# EasyEDA Pro project travellium-12v-desktop-power-supply-cc8d8467.epro, board PCB7
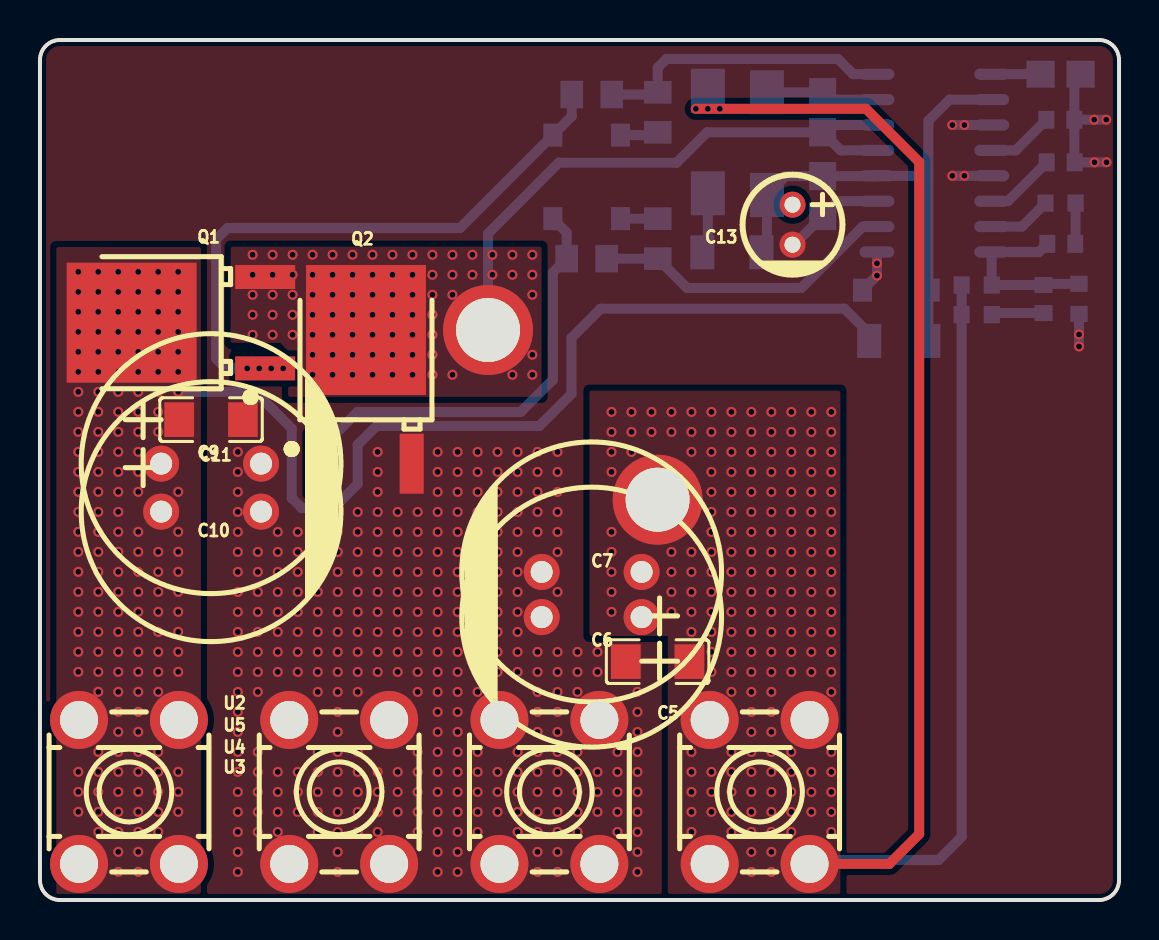
[diagram p11: board, top side]
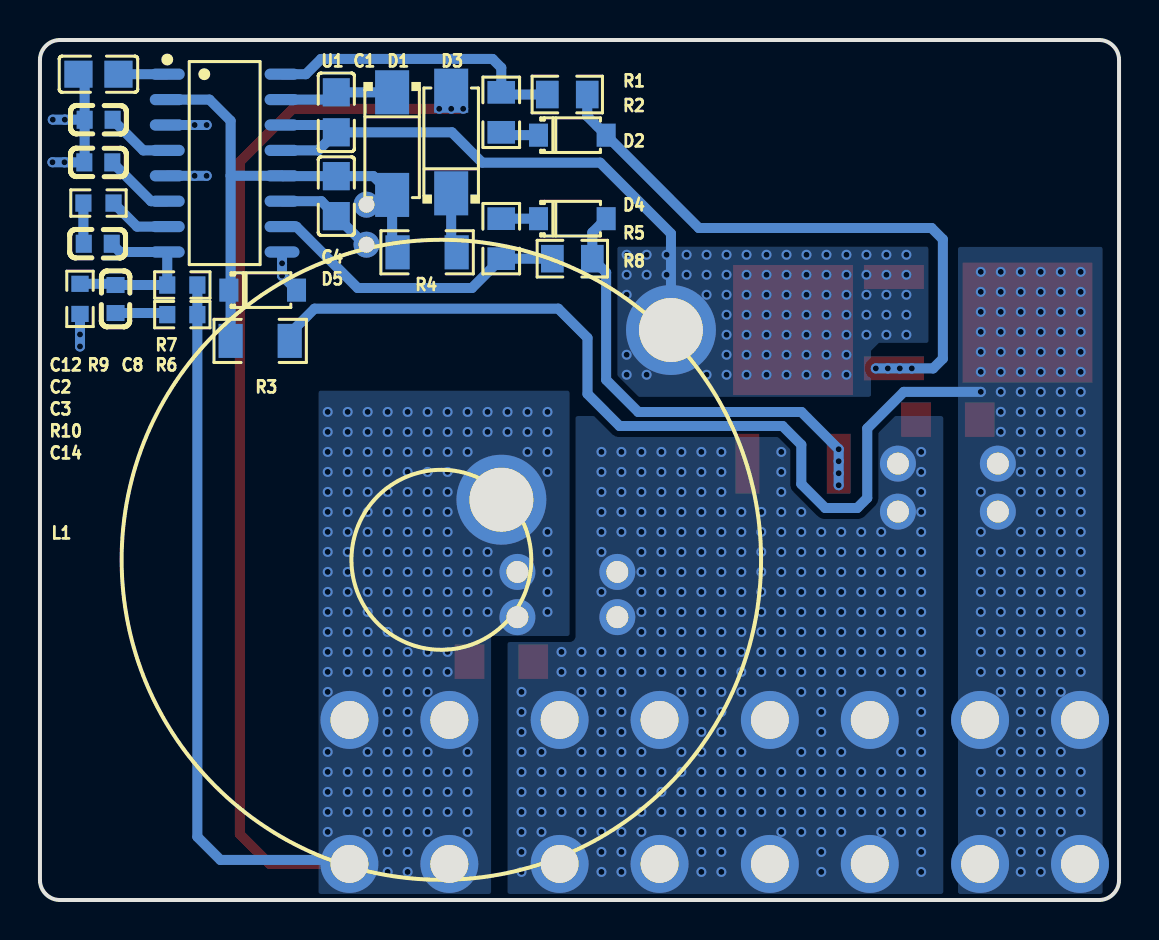
[diagram p12: board, bottom side, seen from below]

Outline 54 x 43 mm; copper layers: Top Layer, Bottom Layer. Coordinates in mm from the lower left corner of the outline.
Outline path: 0,42 0,1 arc(0.29,0.29) 1,0 53,0 arc(53.71,0.29) 54,1 54,42 arc(53.71,42.71) 53,43 1,43 arc(0.29,42.71) 0,42
Stack: Top Layer 0.035mm / Dielectric1 1.51mm FR4 er 4.5 / Bottom Layer 0.035mm

## Design rules (mm)
spacing copperThickness1oz (default): track to track 0.102, other pairs 0.152 to 0.3
spacing copperThickness2oz: track to track 0.203, other pairs 0.152 to 0.3
spacing Plane_innerPlane: track to track 0.102, other pairs 0.152 to 0.3
spacing Copper_copperRegion: track to track 0.102, other pairs 0.152 to 0.3
track width copperThickness1oz: min 0.127, default 0.254, max 2.54
track width copperThickness2oz: min 0.203, default 0.254, max 2.54
track width Travellium (default): min 0.1, default 0.2, max 10
differential pair differentialPair (default): width min 0.127, default 0.254, max 2.54; gap min 0.152, default 0.152
pour e868 uses Copper_copperRegion
pour e870 uses Copper_copperRegion
pour e872 uses Copper_copperRegion
pour e874 uses Copper_copperRegion
pour e876 uses Copper_copperRegion
pour e878 uses Copper_copperRegion
pour e880 uses Copper_copperRegion
pour e882 uses Copper_copperRegion

## Placement (name value [footprint] x y rotation side)
C1  1uF  [C0805]  39.17 39.38 90 bottom
C2  100pF  [C0603]  51.07 39.01 180 bottom
C3  200pF  [C0603]  51.08 36.88 0 bottom
C4  1uF  [C0805]  39.17 35.19 90 bottom
C5  100nF  [C1206]  30.91 11.92 0 top
C6  470uF  [CAP-TH_BD13.0-P5.00-D0.6-FD]  27.61 14.14 180 top
C7  470uF  [CAP-TH_BD13.0-P5.00-D0.6-FD]  27.61 16.4 180 top
C8  10nF  [C0603]  50.22 30.05 270 bottom
C9  470uF  [CAP-TH_BD13.0-P5.00-D0.6-FD]  8.56 21.82 0 top
C10  470uF  [CAP-TH_BD13.0-P5.00-D0.6-FD]  8.56 19.42 0 top
C11  100nF  [C1206]  8.56 24.02 180 top
C12  1uF  [C0805]  51.07 41.29 0 bottom
C13  10uF  [CAP-TH_BD5.0-P2.00-D0.8-FD]  37.66 33.77 270 top
C14  10nF  [C0603]  51.11 32.81 180 bottom
D1  SS14  [SMA_L4.2-W2.6-LS5.3-RD]  36.38 37.82 270 bottom
D2  1N4148W  [SOD-123_L2.8-W1.8-LS3.7-RD]  27.36 38.24 180 bottom
D3  SS14  [SMA_L4.2-W2.6-LS5.3-RD]  33.42 37.9 90 bottom
D4  1N4148W  [SOD-123_L2.8-W1.8-LS3.7-RD]  27.36 34.07 180 bottom
D5  BZT52C18  [SOD-123_L2.8-W1.8-LS3.7-RD]  42.85 30.49 180 bottom
L1  106125-22uH  [106125]  33.91 17.01 135 bottom
Q1  APG095N01K  [TO-252-3_L6.6-W6.1-P4.58-LS10.1-BR-1]  7.93 28.86 0 top
Q2  APG095N01K  [TO-252-3_L6.6-W6.1-P4.58-LS10.1-BR-1]  16.32 25.16 270 top
R1  15Ω  [R0805]  27.61 40.27 180 bottom
R2  2.2Ω  [R0805]  30.92 39.38 270 bottom
R3  75kΩ  [R1206]  42.98 27.95 0 bottom
R4  51Ω  [R1206]  34.63 32.38 180 bottom
R5  2.2Ω  [R0805]  30.92 33.07 90 bottom
R6  1.5kΩ  [R0603]  46.88 29.27 180 bottom
R7  9.1kΩ  [R0603]  46.88 30.75 180 bottom
R8  15Ω  [R0805]  27.36 32.07 180 bottom
R9  1kΩ  [R0603]  52 30.06 90 bottom
R10  20kΩ  [R0603]  51.07 34.85 0 bottom
U1  EG1163S  [SOP-16_L10.0-W3.9-P1.27-LS6.0-BL]  44.76 36.84 270 bottom
U2  T44001  [CONN-TH_T44001]  4.45 5.4 0 top
U3  T44001  [CONN-TH_T44001]  36.01 5.4 0 top
U4  T44001  [CONN-TH_T44001]  25.49 5.4 0 top
U5  T44001  [CONN-TH_T44001]  14.97 5.4 0 top

## Footprints (pads in the part's own frame, mm; a bottom-side part is the same pattern mirrored in y, then rotated)
106125
  round 4.5 hole 3.2: 1(4.25,0) 2(16.25,0)
C0603
  rect 0.8x0.9 smd: 1(-0.7,0) 2(0.7,0)
C0805
  rect 1.41x1.35 smd: 1(-1,0) 2(1,0)
C1206
  rect 1.485x1.728 smd: 1(-1.593,0) 2(1.593,0)
CAP-TH_BD5.0-P2.00-D0.8-FD
  round 1.3 hole 0.8: 1(-1,0) 2(1,0)
CAP-TH_BD13.0-P5.00-D0.6-FD
  round 1.8 hole 1.1: 1(-2.5,0) 2(2.5,0)
CONN-TH_T44001
  round 2.9 hole 1.9: 1(-2.5,3.6) 2(-2.5,-3.6) 3(2.5,-3.6) 4(2.5,3.6)
R0603
  rect 0.806x0.864 smd: 1(-0.753,0) 2(0.753,0)
R0805
  rect 1.133x1.377 smd: 1(-1,0) 2(1,0)
R1206
  rect 1.208x1.701 smd: 1(-1.479,0) 2(1.479,0)
SMA_L4.2-W2.6-LS5.3-RD
  rect 2.2x1.7 smd: 1(-2.566,0) 2(2.566,0)
SOD-123_L2.8-W1.8-LS3.7-RD
  rect 0.95x1.15 smd: 1(-1.692,0) 2(1.692,0)
SOP-16_L10.0-W3.9-P1.27-LS6.0-BL
  oval 0.56x1.745 smd: 1(-4.445,-2.873) 2(-3.175,-2.873) 3(-1.905,-2.873) 4(-0.635,-2.873) 5(0.635,-2.873) 6(1.905,-2.873) 7(3.175,-2.873) 8(4.445,-2.873) 9(4.445,2.873) 10(3.175,2.873) 11(1.905,2.873) 12(0.635,2.873) 13(-0.635,2.873) 14(-1.905,2.873) 15(-3.175,2.873) 16(-4.445,2.873)
TO-252-3_L6.6-W6.1-P4.58-LS10.1-BR-1
  rect 3x1.2 smd: 1(3.342,-2.285) 3(3.342,2.285)
  rect 6.5x6 smd: 2(-3.342,0)

## Nets
As in the schematic.

## Via types
v1: diameter 0.5, hole 0.3, Top Layer to Bottom Layer, 736 vias

## Routing (per net, layer and track width the routed paths; a pad name or vN(x,y) marks a point on that pad's centre or on a via; arc(x,y) is an arc through that point)
GND: length 20.6
  Bottom Layer w0.5: C2.1 51.77,40.98 C12.2 ; C2.1 51.77,36.9 C3.2 52.77,36.88 ; C2.1 51.77,39.02 v1(52.76,39.02) v1(53.36,39.02) ; v1(45.66,38.75) v1(46.26,38.75) U1.3 ; v1(52,27.68) v1(52,28.28) 52,29.3 ; U1.9 v1(41.89,31.83) v1(41.89,31.22) D5.2 ; U1.5 v1(46.26,36.21) v1(45.66,36.21) ; U1.11 39.92,34.94 C4.1 37.74,32.77 C13.2 ; v1(52.77,36.89) v1(53.37,36.89)
  vias: v1(9.9,22.4) v1(9.9,21.4) v1(9.9,20.4) v1(9.9,19.4) v1(9.9,18.4) v1(9.9,17.4) v1(9.9,16.4) v1(9.9,15.4) v1(9.9,14.4) v1(9.9,13.4) v1(9.9,12.4) v1(9.9,11.4) v1(9.9,10.4) v1(9.9,9.4) v1(9.9,8.4) v1(9.9,7.4) v1(9.9,6.4) v1(9.9,5.4) v1(9.9,4.4) v1(9.9,3.4) v1(9.9,2.4) v1(9.9,1.4) v1(10.9,17.4) v1(10.9,16.4) v1(10.9,15.4) v1(10.9,14.4) v1(10.9,13.4) v1(10.9,12.4) v1(10.9,11.4) v1(10.9,10.4) v1(10.9,7.4) v1(10.9,6.4) v1(10.9,5.4) v1(10.9,4.4) v1(10.9,3.4) v1(11.9,18.4) v1(11.9,17.4) v1(11.9,16.4) v1(11.9,15.4) v1(11.9,14.4) v1(11.9,13.4) v1(11.9,12.4) v1(11.9,11.4) v1(11.9,6.4) v1(11.9,5.4) v1(11.9,4.4) v1(11.9,3.4) v1(12.9,18.4) v1(12.9,17.4) v1(12.9,16.4) v1(12.9,15.4) v1(12.9,14.4) v1(12.9,13.4) v1(12.9,12.4) v1(12.9,11.4) v1(12.9,6.4) v1(12.9,5.4) v1(12.9,4.4) v1(13.9,18.4) v1(13.9,17.4) v1(13.9,16.4) v1(13.9,15.4) v1(13.9,14.4) v1(13.9,13.4) v1(13.9,12.4) v1(13.9,11.4) v1(13.9,10.4) v1(13.9,7.4) v1(13.9,6.4) v1(13.9,5.4) v1(13.9,4.4) v1(13.9,3.4) v1(14.9,18.4) v1(14.9,17.4) v1(14.9,16.4) v1(14.9,15.4) v1(14.9,14.4) v1(14.9,13.4) v1(14.9,12.4) v1(14.9,11.4) v1(14.9,10.4) v1(14.9,9.4) v1(14.9,8.4) v1(14.9,7.4) v1(14.9,6.4) v1(14.9,5.4) v1(14.9,4.4) v1(14.9,3.4) v1(14.9,2.4) v1(14.9,1.4) v1(15.9,19.4) v1(15.9,18.4) v1(15.9,17.4) v1(15.9,16.4) v1(15.9,15.4) v1(15.9,14.4) v1(15.9,13.4) v1(15.9,12.4) v1(15.9,11.4) v1(15.9,10.4) v1(15.9,7.4) v1(15.9,6.4) v1(15.9,5.4) v1(15.9,4.4) v1(15.9,3.4) v1(16.9,22.4) v1(16.9,21.4) v1(16.9,20.4) v1(16.9,19.4) v1(16.9,18.4) v1(16.9,17.4) v1(16.9,16.4) v1(16.9,15.4) v1(16.9,14.4) v1(16.9,13.4) v1(16.9,12.4) v1(16.9,11.4) v1(16.9,6.4) v1(16.9,5.4) v1(16.9,4.4) v1(16.9,3.4) v1(17.9,19.4) v1(17.9,18.4) v1(17.9,17.4) v1(17.9,16.4) v1(17.9,15.4) v1(17.9,14.4) v1(17.9,13.4) v1(17.9,12.4) v1(17.9,11.4) v1(17.9,6.4) v1(17.9,5.4) v1(17.9,4.4) v1(18.9,19.4) v1(18.9,18.4) v1(18.9,17.4) v1(18.9,16.4) v1(18.9,15.4) v1(18.9,14.4) v1(18.9,13.4) v1(18.9,12.4) v1(18.9,11.4) v1(18.9,10.4) v1(18.9,7.4) v1(18.9,6.4) v1(18.9,5.4) v1(18.9,4.4) v1(18.9,3.4) v1(19.9,22.4) v1(19.9,21.4) v1(19.9,20.4) v1(19.9,19.4) v1(19.9,18.4) v1(19.9,17.4) v1(19.9,16.4) v1(19.9,15.4) v1(19.9,14.4) v1(19.9,13.4) v1(19.9,12.4) v1(19.9,11.4) v1(19.9,10.4) v1(19.9,9.4) v1(19.9,8.4) v1(19.9,7.4) v1(19.9,6.4) v1(19.9,5.4) v1(19.9,4.4) v1(19.9,3.4) v1(19.9,2.4) v1(19.9,1.4) v1(20.9,22.4) v1(20.9,21.4) v1(20.9,20.4) v1(20.9,19.4) v1(20.9,18.4) v1(20.9,17.4) v1(20.9,16.4) v1(20.9,15.4) v1(20.9,14.4) v1(20.9,13.4) v1(20.9,12.4) v1(20.9,11.4) v1(20.9,10.4) v1(20.9,9.4) v1(20.9,8.4) v1(20.9,7.4) v1(20.9,6.4) v1(20.9,5.4) v1(20.9,4.4) v1(20.9,3.4) v1(20.9,2.4) v1(20.9,1.4) v1(21.9,22.4) v1(21.9,21.4) v1(21.9,20.4) v1(21.9,19.4) v1(21.9,18.4) v1(21.9,17.4) v1(21.9,16.4) v1(21.9,15.4) v1(21.9,14.4) v1(21.9,13.4) v1(21.9,12.4) v1(21.9,11.4) v1(21.9,10.4) v1(21.9,7.4) v1(21.9,6.4) v1(21.9,5.4) v1(21.9,4.4) v1(21.9,3.4) v1(22.9,22.4) v1(22.9,21.4) v1(22.9,20.4) v1(22.9,19.4) v1(22.9,18.4) v1(22.9,17.4) v1(22.9,16.4) v1(22.9,15.4) v1(22.9,14.4) v1(22.9,13.4) v1(22.9,12.4) v1(22.9,11.4) v1(22.9,6.4) v1(22.9,5.4) v1(22.9,4.4) v1(23.9,22.4) v1(23.9,21.4) v1(23.9,20.4) v1(23.9,19.4) v1(23.9,18.4) v1(23.9,17.4) v1(23.9,16.4) v1(23.9,15.4) v1(23.9,14.4) v1(23.9,13.4) v1(23.9,12.4) v1(23.9,11.4) v1(23.9,7.4) v1(23.9,6.4) v1(23.9,5.4) v1(23.9,4.4) v1(23.9,3.4) v1(24.9,22.4) v1(24.9,21.4) v1(24.9,20.4) v1(24.9,19.4) v1(24.9,18.4) v1(24.9,12.4) v1(24.9,11.4) v1(24.9,10.4) v1(24.9,9.4) v1(24.9,8.4) v1(24.9,7.4) v1(24.9,6.4) v1(24.9,5.4) v1(24.9,4.4) v1(24.9,3.4) v1(24.9,2.4) v1(24.9,1.4) v1(25.9,22.4) v1(25.9,21.4) v1(25.9,20.4) v1(25.9,19.4) v1(25.9,18.4) v1(25.9,17.4) v1(25.9,15.4) v1(25.9,12.4) v1(25.9,11.4) v1(25.9,10.4) v1(25.9,9.4) v1(25.9,8.4) v1(25.9,7.4) v1(25.9,6.4) v1(25.9,5.4) v1(25.9,4.4) v1(25.9,3.4) v1(25.9,2.4) v1(25.9,1.4) v1(26.9,12.4) v1(26.9,11.4) v1(26.9,10.4) v1(26.9,7.4) v1(26.9,6.4) v1(26.9,5.4) v1(26.9,4.4) v1(26.9,3.4) v1(27.9,12.4) v1(27.9,11.4) v1(27.9,6.4) v1(27.9,5.4) v1(27.9,4.4) v1(28.9,7.4) v1(28.9,6.4) v1(28.9,5.4) v1(28.9,4.4) v1(28.9,3.4) v1(29.9,10.4) v1(29.9,9.4) v1(29.9,8.4) v1(29.9,7.4) v1(29.9,6.4) v1(29.9,5.4) v1(29.9,4.4) v1(29.9,3.4) v1(29.9,2.4) v1(29.9,1.4)
P5V: length 2.4
  Bottom Layer w0.5: C12.1 U1.1
P12V: length 87.7
  Top Layer w0.5: U3.3 42.5,1.8 44,3.3 44,36.9 41.34,39.56 v1(34.02,39.56) v1(33.42,39.56) v1(32.82,39.56)
  Bottom Layer w0.5: 38.51,2 44.97,2 46.12,3.16 R6.2 R7.2
  vias: v1(28.6,24.4) v1(28.6,23.4) v1(28.6,22.4) v1(28.6,21.4) v1(28.6,18.4) v1(28.6,17.4) v1(28.6,16.4) v1(28.6,15.4) v1(28.6,14.4) v1(29.6,24.4) v1(29.6,23.4) v1(29.6,22.4) v1(30.6,24.4) v1(30.6,23.4) v1(31.6,24.4) v1(31.6,23.4) v1(31.6,17.4) v1(31.6,16.4) v1(31.6,15.4) v1(31.6,14.4) v1(32.6,24.4) v1(32.6,23.4) v1(32.6,22.4) v1(32.6,17.4) v1(32.6,16.4) v1(32.6,15.4) v1(32.6,14.4) v1(32.6,13.4) v1(32.6,7.4) v1(32.6,6.4) v1(32.6,5.4) v1(32.6,4.4) v1(32.6,3.4) v1(33.6,24.4) v1(33.6,23.4) v1(33.6,22.4) v1(33.6,21.4) v1(33.6,20.4) v1(33.6,19.4) v1(33.6,18.4) v1(33.6,17.4) v1(33.6,16.4) v1(33.6,15.4) v1(33.6,14.4) v1(33.6,13.4) v1(33.6,12.4) v1(33.6,11.4) v1(33.6,6.4) v1(33.6,5.4) v1(33.6,4.4) v1(34.6,24.4) v1(34.6,23.4) v1(34.6,22.4) v1(34.6,21.4) v1(34.6,20.4) v1(34.6,19.4) v1(34.6,18.4) v1(34.6,17.4) v1(34.6,16.4) v1(34.6,15.4) v1(34.6,14.4) v1(34.6,13.4) v1(34.6,12.4) v1(34.6,11.4) v1(34.6,10.4) v1(34.6,7.4) v1(34.6,6.4) v1(34.6,5.4) v1(34.6,4.4) v1(34.6,3.4) v1(35.6,24.4) v1(35.6,23.4) v1(35.6,22.4) v1(35.6,21.4) v1(35.6,20.4) v1(35.6,19.4) v1(35.6,18.4) v1(35.6,17.4) v1(35.6,16.4) v1(35.6,15.4) v1(35.6,14.4) v1(35.6,13.4) v1(35.6,12.4) v1(35.6,11.4) v1(35.6,10.4) v1(35.6,9.4) v1(35.6,8.4) v1(35.6,7.4) v1(35.6,6.4) v1(35.6,5.4) v1(35.6,4.4) v1(35.6,3.4) v1(35.6,2.4) v1(35.6,1.4) v1(36.6,24.4) v1(36.6,23.4) v1(36.6,22.4) v1(36.6,21.4) v1(36.6,20.4) v1(36.6,19.4) v1(36.6,18.4) v1(36.6,17.4) v1(36.6,16.4) v1(36.6,15.4) v1(36.6,14.4) v1(36.6,13.4) v1(36.6,12.4) v1(36.6,11.4) v1(36.6,10.4) v1(36.6,9.4) v1(36.6,8.4) v1(36.6,7.4) v1(36.6,6.4) v1(36.6,5.4) v1(36.6,4.4) v1(36.6,3.4) v1(36.6,2.4) v1(36.6,1.4) v1(37.6,24.4) v1(37.6,23.4) v1(37.6,22.4) v1(37.6,21.4) v1(37.6,20.4) v1(37.6,19.4) v1(37.6,18.4) v1(37.6,17.4) v1(37.6,16.4) v1(37.6,15.4) v1(37.6,14.4) v1(37.6,13.4) v1(37.6,12.4) v1(37.6,11.4) v1(37.6,7.4) v1(37.6,6.4) v1(37.6,5.4) v1(37.6,4.4) v1(37.6,3.4) v1(38.6,24.4) v1(38.6,23.4) v1(38.6,22.4) v1(38.6,21.4) v1(38.6,20.4) v1(38.6,19.4) v1(38.6,18.4) v1(38.6,17.4) v1(38.6,16.4) v1(38.6,15.4) v1(38.6,14.4) v1(38.6,13.4) v1(38.6,12.4) v1(38.6,11.4) v1(38.6,6.4) v1(38.6,5.4) v1(38.6,4.4) v1(39.6,24.4) v1(39.6,23.4) v1(39.6,22.4) v1(39.6,21.4) v1(39.6,20.4) v1(39.6,19.4) v1(39.6,18.4) v1(39.6,17.4) v1(39.6,16.4) v1(39.6,15.4) v1(39.6,14.4) v1(39.6,13.4) v1(39.6,12.4) v1(39.6,11.4) v1(39.6,10.4) v1(39.6,7.4) v1(39.6,6.4) v1(39.6,5.4) v1(39.6,4.4) v1(39.6,3.4)
P60V: length 46.8
  Bottom Layer w0.5: R3.1 41.5,28.33 40.26,29.57 28.06,29.57 26.6,28.11 26.6,25.31 24.99,23.7 16.84,23.7 15.9,22.76 15.9,20.8 14.7,19.6 13.1,19.6 12.6,20.1 12.6,23.58 10.77,25.41 v1(6.92,25.41)
  vias: v1(1.92,31.41) v1(1.92,30.41) v1(1.92,29.41) v1(1.92,28.41) v1(1.92,27.41) v1(1.92,26.41) v1(1.92,25.41) v1(1.92,24.41) v1(1.92,23.41) v1(1.92,22.41) v1(1.92,21.41) v1(1.92,20.41) v1(1.92,19.41) v1(1.92,18.41) v1(1.92,17.41) v1(1.92,16.41) v1(1.92,15.41) v1(1.92,14.41) v1(1.92,13.41) v1(1.92,12.41) v1(1.92,11.41) v1(1.92,6.41) v1(1.92,5.41) v1(1.92,4.41) v1(2.92,31.41) v1(2.92,30.41) v1(2.92,29.41) v1(2.92,28.41) v1(2.92,27.41) v1(2.92,26.41) v1(2.92,25.41) v1(2.92,24.41) v1(2.92,23.41) v1(2.92,22.41) v1(2.92,21.41) v1(2.92,20.41) v1(2.92,19.41) v1(2.92,18.41) v1(2.92,17.41) v1(2.92,16.41) v1(2.92,15.41) v1(2.92,14.41) v1(2.92,13.41) v1(2.92,12.41) v1(2.92,11.41) v1(2.92,10.41) v1(2.92,7.41) v1(2.92,6.41) v1(2.92,5.41) v1(2.92,4.41) v1(2.92,3.41) v1(3.92,31.41) v1(3.92,30.41) v1(3.92,29.41) v1(3.92,28.41) v1(3.92,27.41) v1(3.92,26.41) v1(3.92,25.41) v1(3.92,24.41) v1(3.92,23.41) v1(3.92,22.41) v1(3.92,21.41) v1(3.92,20.41) v1(3.92,19.41) v1(3.92,18.41) v1(3.92,17.41) v1(3.92,16.41) v1(3.92,15.41) v1(3.92,14.41) v1(3.92,13.41) v1(3.92,12.41) v1(3.92,11.41) v1(3.92,10.41) v1(3.92,9.41) v1(3.92,8.41) v1(3.92,7.41) v1(3.92,6.41) v1(3.92,5.41) v1(3.92,4.41) v1(3.92,3.41) v1(3.92,2.41) v1(3.92,1.41) v1(4.92,31.41) v1(4.92,30.41) v1(4.92,29.41) v1(4.92,28.41) v1(4.92,27.41) v1(4.92,26.41) v1(4.92,25.41) v1(4.92,24.41) v1(4.92,23.41) v1(4.92,22.41) v1(4.92,21.41) v1(4.92,20.41) v1(4.92,18.41) v1(4.92,17.41) v1(4.92,16.41) v1(4.92,15.41) v1(4.92,14.41) v1(4.92,13.41) v1(4.92,12.41) v1(4.92,11.41) v1(4.92,10.41) v1(4.92,9.41) v1(4.92,8.41) v1(4.92,7.41) v1(4.92,6.41) v1(4.92,5.41) v1(4.92,4.41) v1(4.92,3.41) v1(4.92,2.41) v1(4.92,1.41) v1(5.92,31.41) v1(5.92,30.41) v1(5.92,29.41) v1(5.92,28.41) v1(5.92,27.41) v1(5.92,26.41) v1(5.92,25.41) v1(5.92,24.41) v1(5.92,23.41) v1(5.92,17.41) v1(5.92,16.41) v1(5.92,15.41) v1(5.92,14.41) v1(5.92,13.41) v1(5.92,12.41) v1(5.92,11.41) v1(5.92,10.41) v1(5.92,7.41) v1(5.92,6.41) v1(5.92,5.41) v1(5.92,4.41) v1(5.92,3.41) v1(6.92,31.41) v1(6.92,30.41) v1(6.92,29.41) v1(6.92,28.41) v1(6.92,27.41) v1(6.92,26.41) v1(6.92,20.41) v1(6.92,18.41) v1(6.92,17.41) v1(6.92,16.41) v1(6.92,15.41) v1(6.92,14.41) v1(6.92,13.41) v1(6.92,12.41) v1(6.92,11.41) v1(6.92,6.41) v1(6.92,5.41) v1(6.92,4.41)
VCC: length 27.6
  Bottom Layer w0.5: 44.46,36.21 U1.12 41.87,36.19 C4.2 37.32,36.19 D1.2 ; 44.46,36.21 44.46,38.96 45.52,40.02 U1.2 ; 44.46,36.21 R3.2 ; D1.2 36.38,32.66 R4.1 ; D1.2 36.86,34.77 C13.1
ERRO: length 3.2
  Bottom Layer w0.5: R10.1 49.14,33.67 U1.7
FB: length 9
  Bottom Layer w0.5: C14.2 50,32.4 U1.8 R7.1 C8.1 50.28,30.81 R9.2
$1N5402: length 1.9
  Bottom Layer w0.5: D2.1 30.77,38.24 R2.2
$1N5404: length 31
  Bottom Layer w0.5: R1.2 26.61,39.19 D2.2 21.02,33.6 9.38,33.6 8.82,33.03 8.82,27.07 9.3,26.58 v1(10.37,26.58) v1(10.97,26.58) v1(11.57,26.58) v1(12.17,26.58)
$1N5419: length 15
  Bottom Layer w0.5: R1.1 30.8,40.27 R2.1 30.92,41.61 31.35,42.05 39.93,42.05 40.69,41.29 U1.16
$1N5577: length 1.9
  Bottom Layer w0.5: D4.1 R5.2
$1N5579: length 23.5
  Bottom Layer w0.5: D4.2 26.36,33.37 R8.2 25.67,31.37 25.67,26.01 24.06,24.4 15.89,24.4 v1(14.03,22.54) v1(14.03,21.94) v1(14.03,21.34) v1(14.03,20.74)
$1N5584: length 15.4
  Bottom Layer w0.5: U1.10 41.17,33.67 38.1,30.6 32.38,30.6 R5.1 R8.1
$1N13099: length 2.6
  Bottom Layer w0.5: C8.2 47.71,29.35 R6.1
$1N13510: length 2
  Bottom Layer w0.5: C14.1 51.83,32.83 R10.2
$1N13843: length 5.7
  Bottom Layer w0.5: D1.1 C1.2 39.54,40.02 U1.15
$1N13856: length 29.1
  Bottom Layer w0.5: 22.42,28.98 22.42,33.32 25.97,36.87 31.87,36.87 33.39,38.38 C1.1 ; C1.1 39.54,38.75 U1.14 ; C1.1 40.08,37.48 U1.13
  vias: v1(10.64,32.26) v1(10.64,31.26) v1(10.64,30.26) v1(10.64,29.26) v1(10.64,28.26) v1(11.64,32.26) v1(11.64,31.26) v1(11.64,30.26) v1(11.64,29.26) v1(11.64,28.26) v1(12.64,32.26) v1(12.64,31.26) v1(12.64,30.26) v1(12.64,29.26) v1(12.64,28.26) v1(13.64,32.26) v1(13.64,31.26) v1(13.64,30.26) v1(13.64,29.26) v1(13.64,28.26) v1(13.64,27.26) v1(13.64,26.26) v1(14.64,32.26) v1(14.64,31.26) v1(14.64,30.26) v1(14.64,29.26) v1(14.64,28.26) v1(14.64,27.26) v1(14.64,26.26) v1(15.64,32.26) v1(15.64,31.26) v1(15.64,30.26) v1(15.64,29.26) v1(15.64,28.26) v1(15.64,27.26) v1(15.64,26.26) v1(16.64,32.26) v1(16.64,31.26) v1(16.64,30.26) v1(16.64,29.26) v1(16.64,28.26) v1(16.64,27.26) v1(16.64,26.26) v1(17.64,32.26) v1(17.64,31.26) v1(17.64,30.26) v1(17.64,29.26) v1(17.64,28.26) v1(17.64,27.26) v1(17.64,26.26) v1(18.64,32.26) v1(18.64,31.26) v1(18.64,30.26) v1(18.64,29.26) v1(18.64,28.26) v1(18.64,27.26) v1(18.64,26.26) v1(19.64,32.26) v1(19.64,31.26) v1(19.64,30.26) v1(19.64,29.26) v1(19.64,28.26) v1(19.64,27.26) v1(19.64,26.26) v1(20.64,32.26) v1(20.64,31.26) v1(20.64,30.26) v1(20.64,26.26) v1(21.64,32.26) v1(21.64,31.26) v1(22.64,32.26) v1(22.64,31.26) v1(23.64,32.26) v1(23.64,31.26) v1(23.64,26.26) v1(24.64,32.26) v1(24.64,31.26) v1(24.64,30.26) v1(24.64,27.26) v1(24.64,26.26)
$1N14575: length 3.4
  Bottom Layer w0.5: 50.36,39.01 48.83,37.48 U1.4
$1N14672: length 3.6
  Bottom Layer w0.5: C3.1 48.44,34.94 U1.6
$1N14708: length 3.1
  Bottom Layer w0.5: D3.1 33.42,32.66 33.15,32.38

## Copper pours and planes (outline as drawn; the poured copper is in the pictures)
GND on Top Layer: 0,43 54,43 54,0 0,0
GND on Bottom Layer: 8.8,24.2 30.6,24.2 30.6,0.3 8.8,0.3
P12V on Top Layer: 31.42,0.27 31.42,13.2 27.5,13.2 27.5,25.47 40.06,25.47 40.06,0.27
P12V on Bottom Layer: 31.42,0.27 31.42,13.2 27.5,13.2 27.5,25.47 40.06,25.47 40.06,0.27
P60V on Top Layer: 8.05,32.65 8.05,0.31 0.82,0.31 0.82,32.65
P60V on Bottom Layer: 8.05,32.65 8.05,0.31 0.82,0.31 0.82,32.65
$1N13856 on Top Layer: 9.54,32.67 25.1,32.67 25.1,25.16 12.41,25.16 12.41,27.46 12.02,27.86 9.54,27.86
$1N13856 on Bottom Layer: 9.54,32.67 25.1,32.67 25.1,25.16 12.41,25.16 12.41,27.46 12.02,27.86 9.54,27.86
